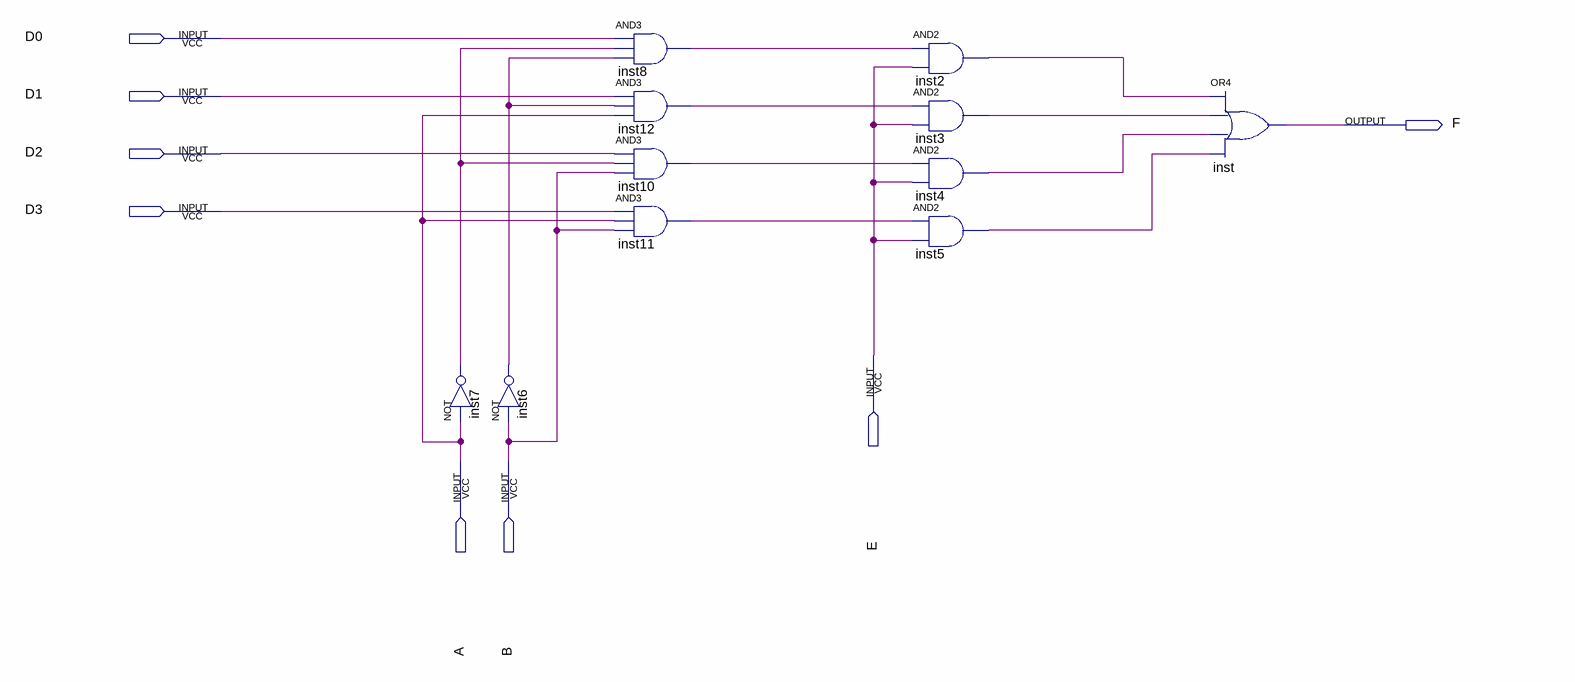
[diagram p0: schematic sheet]
// Quartus schematic multiplexer_4-1.bdf as structural Verilog: 11 symbols, 8 pins
module \multiplexer_4-1  (
  input  D0,
  input  D1,
  input  D2,
  input  D3,
  input  E,
  input  A,
  input  B,
  output F
);

  wire inst2_out, inst3_out, inst4_out, inst5_out, inst6_out, inst7_out, inst8_out, inst10_out, inst11_out,
       inst12_out;

  not inst7 (inst7_out, A);
  not inst6 (inst6_out, B);
  and inst8 (inst8_out, D0, inst7_out, inst6_out);
  and inst12 (inst12_out, D1, inst6_out, A);
  and inst10 (inst10_out, D2, inst7_out, B);
  and inst11 (inst11_out, D3, A, B);
  and inst2 (inst2_out, inst8_out, E);
  and inst3 (inst3_out, inst12_out, E);
  and inst4 (inst4_out, inst10_out, E);
  and inst5 (inst5_out, inst11_out, E);
  or inst (F, inst2_out, inst3_out, inst4_out, inst5_out);
endmodule
